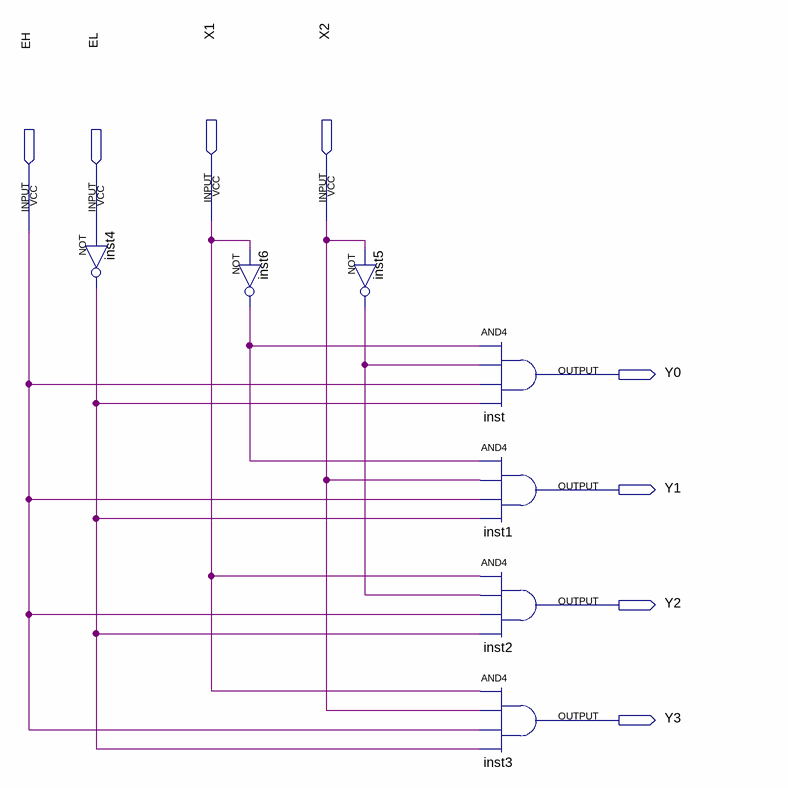
[diagram p0: schematic sheet]
// Quartus schematic Dec2_4.bdf as structural Verilog: 7 symbols, 8 pins
module Dec2_4 (
  input  X1,
  input  X2,
  input  EH,
  input  EL,
  output Y0,
  output Y1,
  output Y2,
  output Y3
);

  wire inst4_out, inst5_out, inst6_out;

  not inst4 (inst4_out, EL);
  not inst6 (inst6_out, X1);
  not inst5 (inst5_out, X2);
  and inst (Y0, inst6_out, inst5_out, EH, inst4_out);
  and inst1 (Y1, inst6_out, X2, EH, inst4_out);
  and inst2 (Y2, X1, inst5_out, EH, inst4_out);
  and inst3 (Y3, X1, X2, EH, inst4_out);
endmodule
